# Altium schematic sheet bus-harness-demo.SchDoc
size 152 x 101 mm
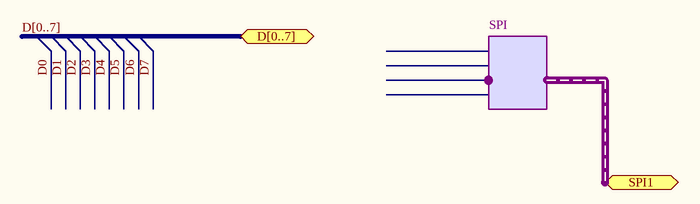
[diagram p0: bus-harness-demo.SchDoc]

## Ports
D[0..7], SPI1 (harness SPI)

## Harnesses
?: 

## Buses and harness runs
bus D[0..7] = port D[0..7]